# Altium schematic sheet EtherCAT_to_CAN.SchDoc
size 594 x 420 mm; SheetNumber: 1; SheetTotal: 1
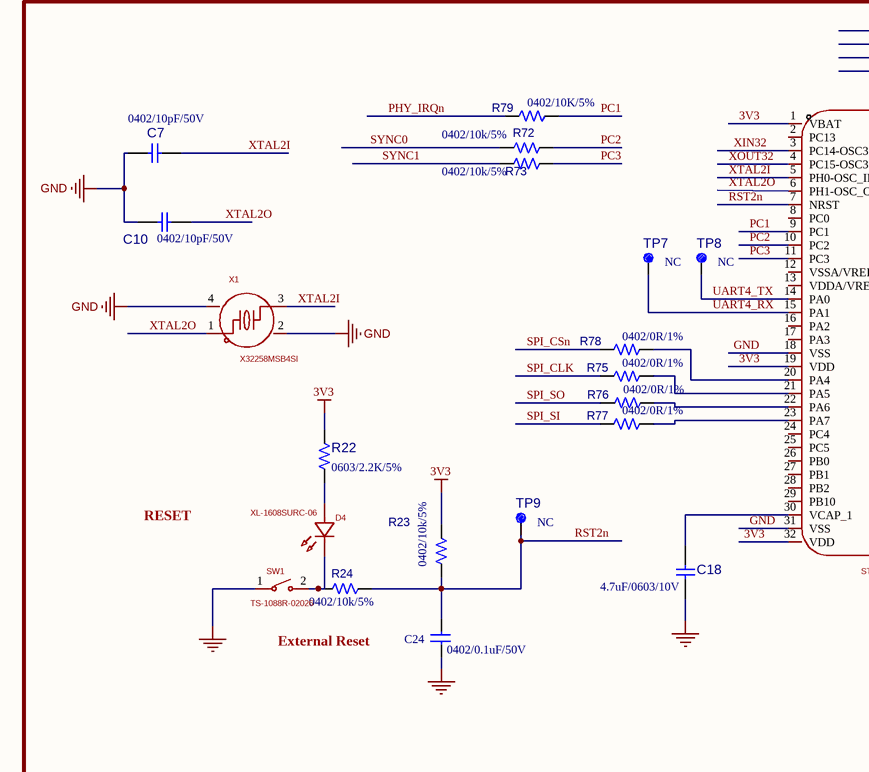
[diagram p0: EtherCAT_to_CAN.SchDoc, top left]
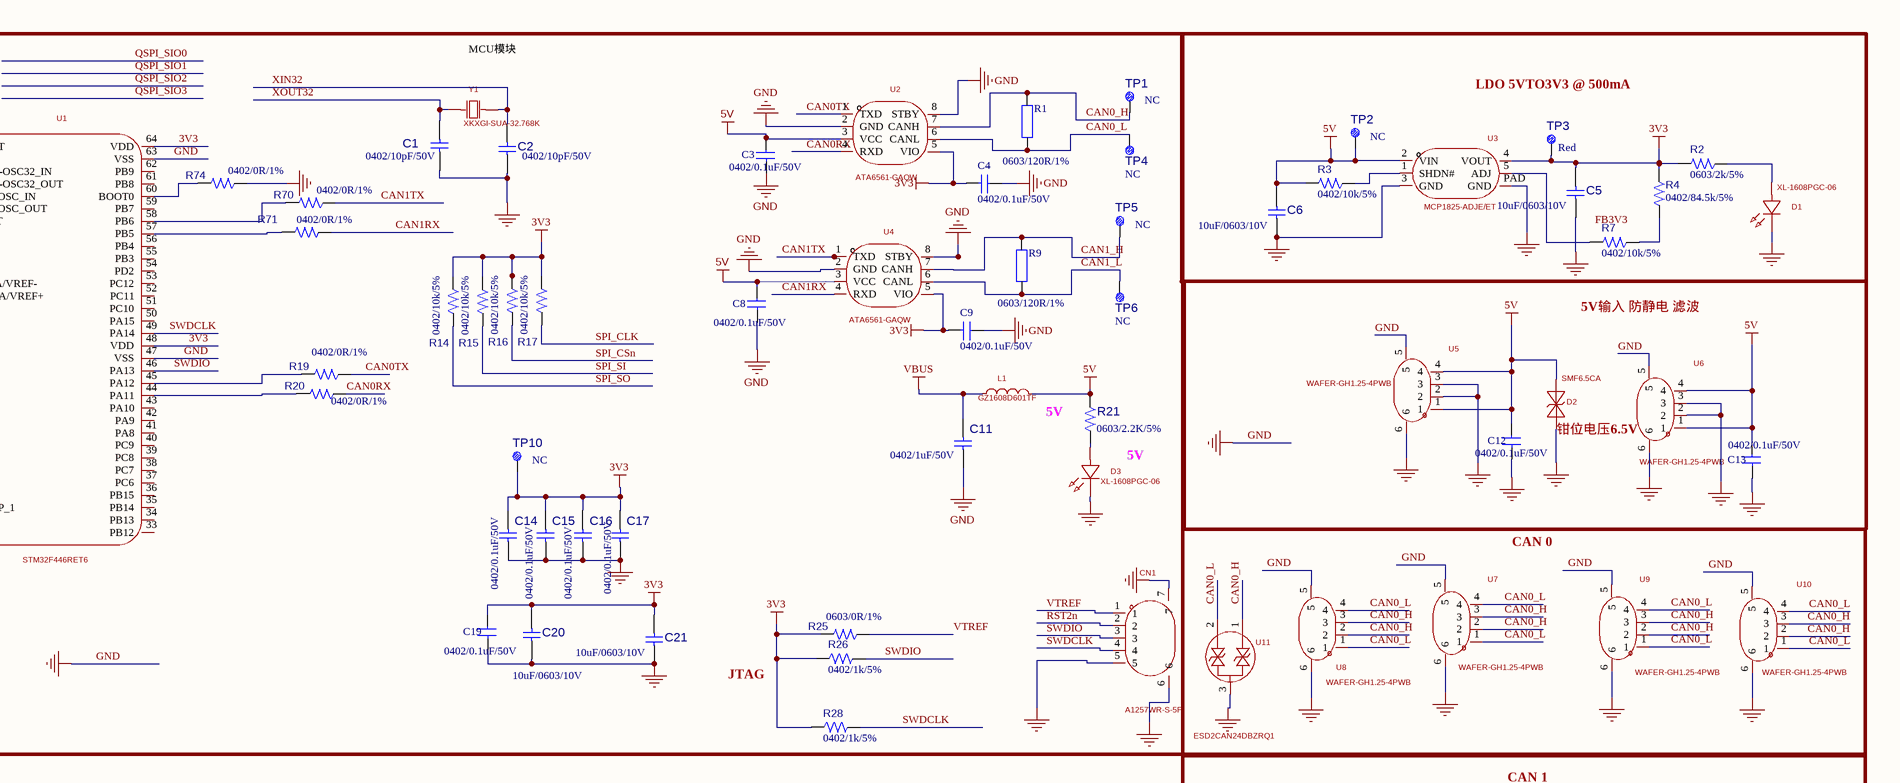
[diagram p1: EtherCAT_to_CAN.SchDoc, top right]
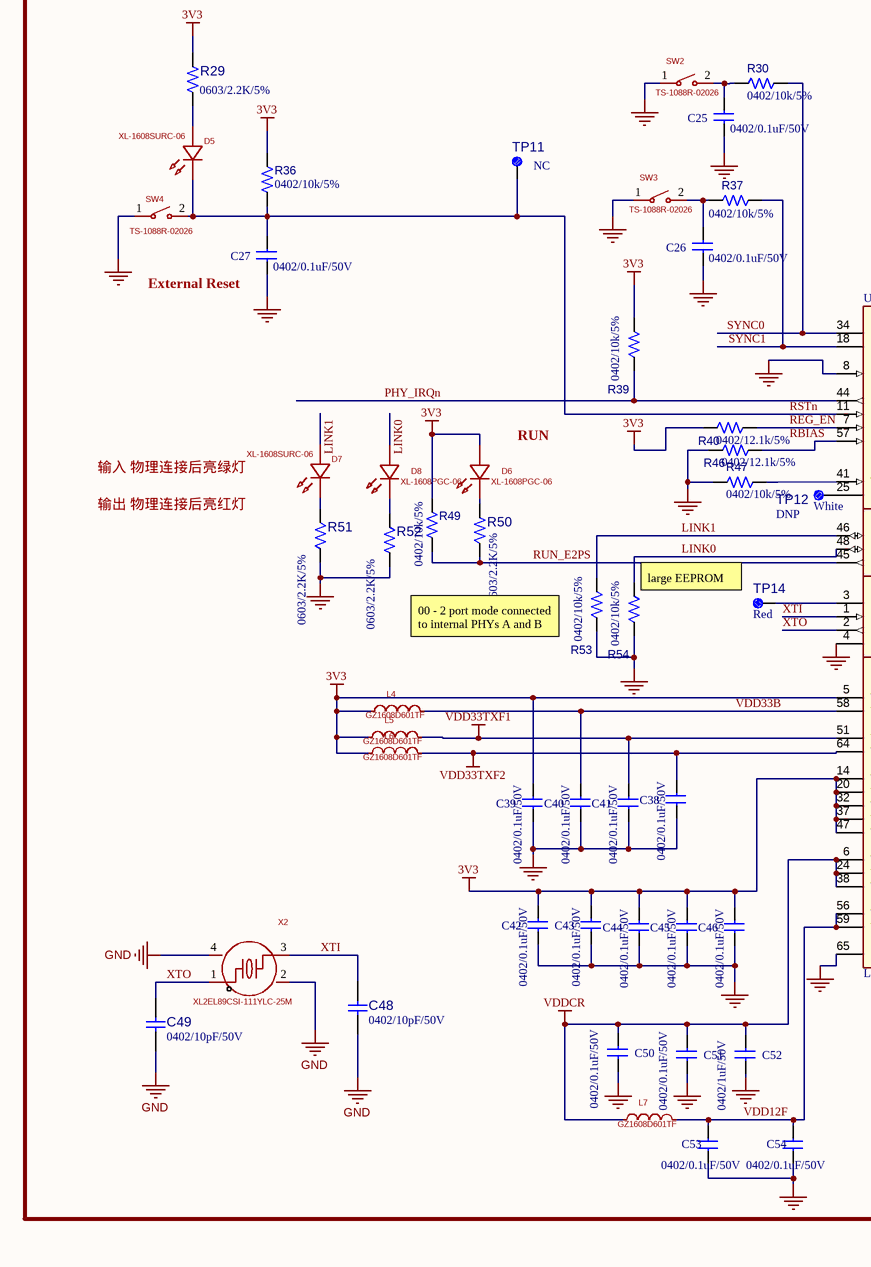
[diagram p2: EtherCAT_to_CAN.SchDoc, bottom left]
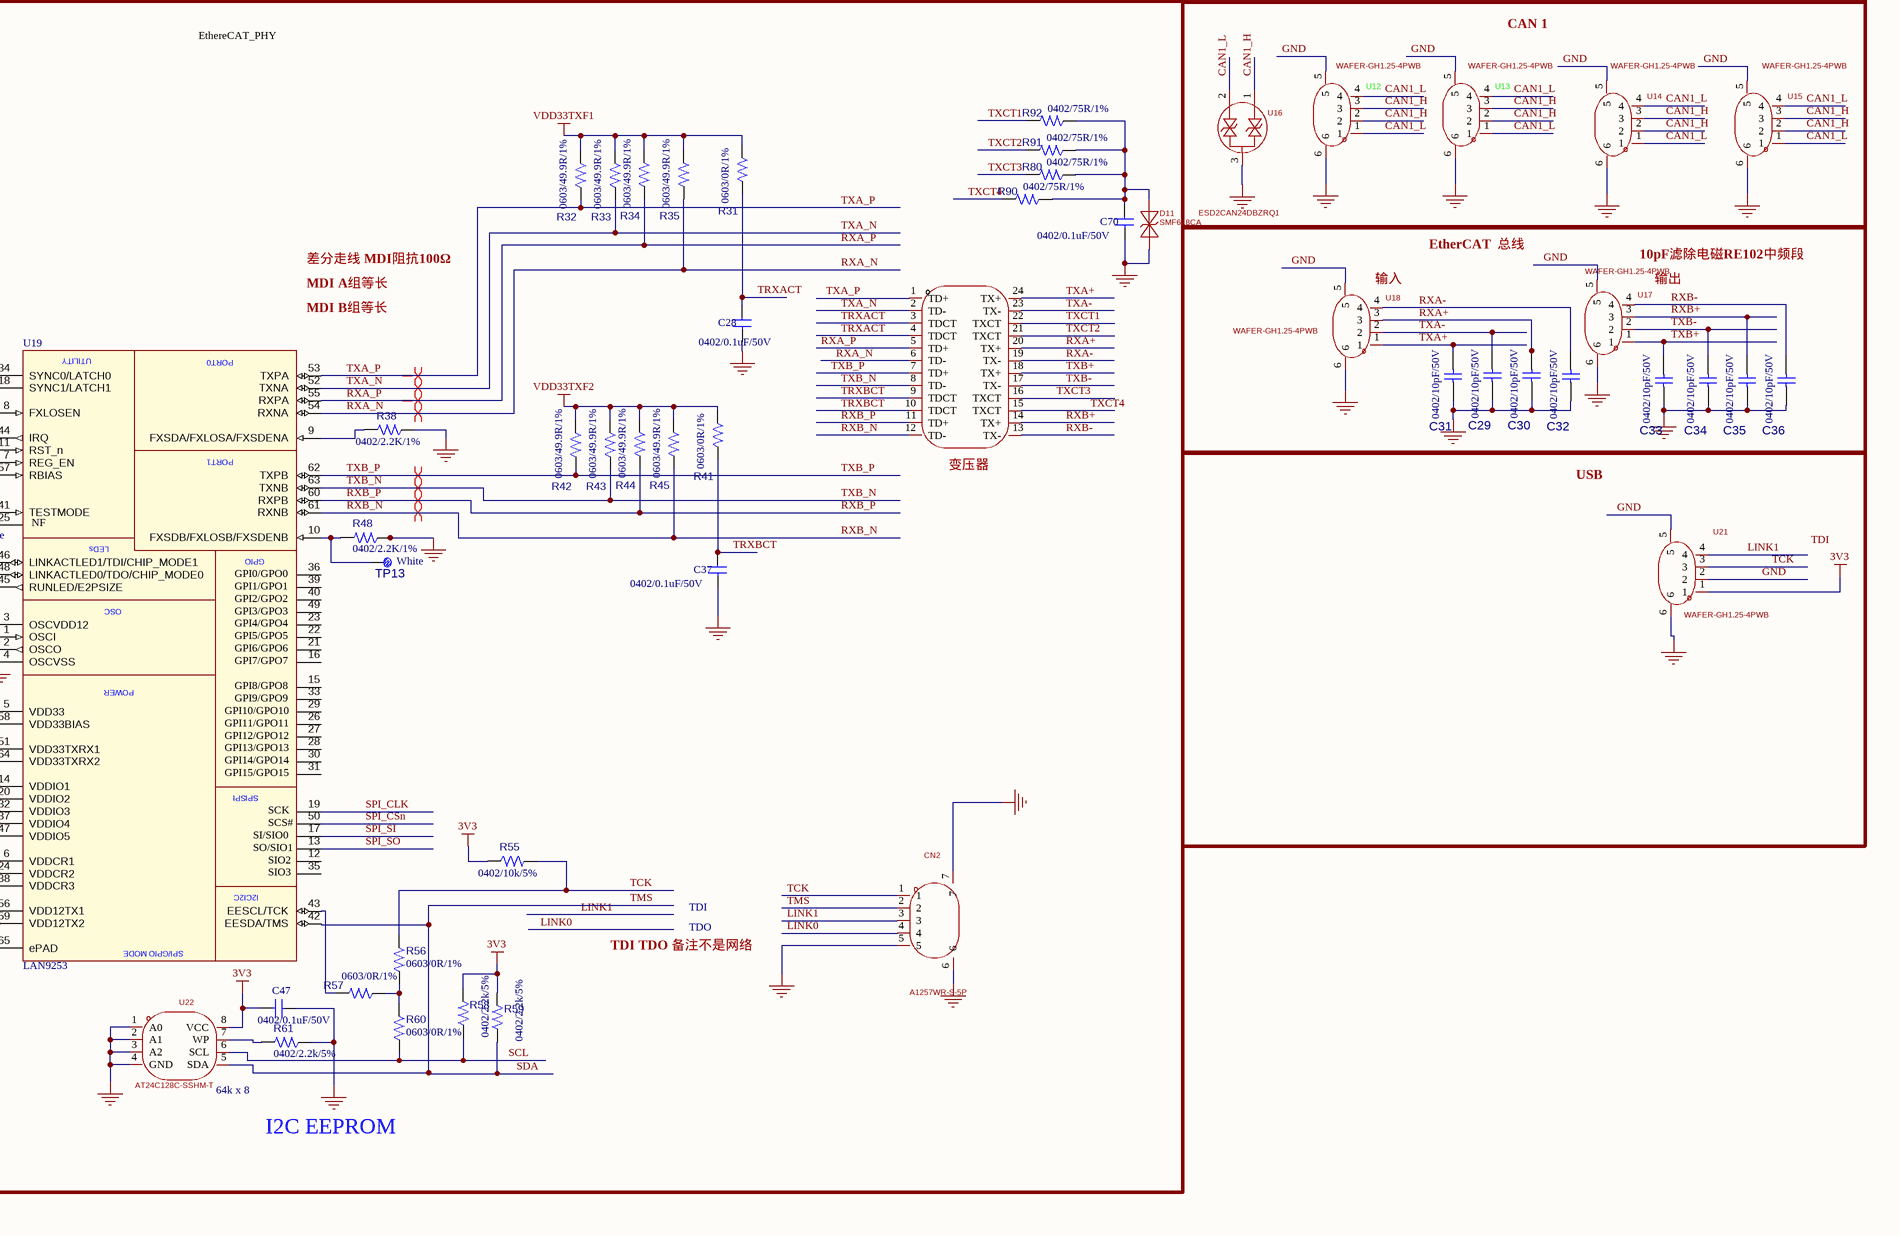
[diagram p3: EtherCAT_to_CAN.SchDoc, bottom right]

## Parts
C1  0402/10pF/50V  [C0402]
C2  0402/10pF/50V  [C0402]
C3  0402/0.1uF/50V  [C0402]
C4  0402/0.1uF/50V  [C0402]
C5  10uF/0603/10V  [C0603]
C6  10uF/0603/10V  [C0603]
C7  0402/10pF/50V  [C0402]
C8  0402/0.1uF/50V  [C0402]
C9  0402/0.1uF/50V  [C0402]
C10  0402/10pF/50V  [C0402]
C11  0402/1uF/50V  [C0402]
C12  0402/0.1uF/50V  [C0402]
C13  0402/0.1uF/50V  [C0402]
C14  0402/0.1uF/50V  [C0402]
C15  0402/0.1uF/50V  [C0402]
C16  0402/0.1uF/50V  [C0402]
C17  0402/0.1uF/50V  [C0402]
C18  4.7uF/0603/10V  [C0603]
C19  0402/0.1uF/50V  [C0402]
C20  10uF/0603/10V  [C0603]
C21  10uF/0603/10V  [C0603]
C24  0402/0.1uF/50V  [C0402]
C25  0402/0.1uF/50V  [C0402]
C26  0402/0.1uF/50V  [C0402]
C27  0402/0.1uF/50V  [C0402]
C28  0402/0.1uF/50V  [C0402]
C29  0402/10pF/50V  [C0402]
C30  0402/10pF/50V  [C0402]
C31  0402/10pF/50V  [C0402]
C32  0402/10pF/50V  [C0402]
C33  0402/10pF/50V  [C0402]
C34  0402/10pF/50V  [C0402]
C35  0402/10pF/50V  [C0402]
C36  0402/10pF/50V  [C0402]
C37  0402/0.1uF/50V  [C0402]
C38  0402/0.1uF/50V  [C0402]
C39  0402/0.1uF/50V  [C0402]
C40  0402/0.1uF/50V  [C0402]
C41  0402/0.1uF/50V  [C0402]
C42  0402/0.1uF/50V  [C0402]
C43  0402/0.1uF/50V  [C0402]
C44  0402/0.1uF/50V  [C0402]
C45  0402/0.1uF/50V  [C0402]
C46  0402/0.1uF/50V  [C0402]
C47  0402/0.1uF/50V  [C0402]
C48  0402/10pF/50V  [C0402]
C49  0402/10pF/50V  [C0402]
C50  0402/0.1uF/50V  [C0402]
C51  0402/0.1uF/50V  [C0402]
C52  0402/1uF/50V  [C0402]
C53  0402/0.1uF/50V  [C0402]
C54  0402/0.1uF/50V  [C0402]
C70  0402/0.1uF/50V  [C0402]
CN1  A1257WR-S-5P  [CONN-SMD_A1257WR-S-5P]
CN2  A1257WR-S-5P  [CONN-SMD_A1257WR-S-5P]
D1  XL-1608PGC-06  [LED0603-RD_GREEN]
D2  SMF6.5CA  [SOD-123FL_L2.7-W1.8-LS3.8-BI]
D3  XL-1608PGC-06  [LED0603-RD_GREEN]
D4  XL-1608SURC-06  [LED0603-RD_RED]
D5  XL-1608SURC-06  [LED0603-RD_RED]
D6  XL-1608PGC-06  [LED0603-RD_GREEN]
D7  XL-1608SURC-06  [LED0603-RD_RED]
D8  XL-1608PGC-06  [LED0603-RD_GREEN]
D11  SMF618CA  [SOD-123FL_L2.7-W1.8-LS3.8-BI]
L1  GZ1608D601TF  [L0603]
L4  GZ1608D601TF  [L0603]
L5  GZ1608D601TF  [L0603]
L6  GZ1608D601TF  [L0603]
L7  GZ1608D601TF  [L0603]
R1  0603/120R/1%  [R0603]
R2  0603/2k/5%  [R0603]
R3  0402/10k/5%  [R0402]
R4  0402/84.5k/5%  [R0402]
R7  0402/10k/5%  [R0402]
R9  0603/120R/1%  [R0603]
R14  0402/10k/5%  [R0402]
R15  0402/10k/5%  [R0402]
R16  0402/10k/5%  [R0402]
R17  0402/10k/5%  [R0402]
R19  0402/0R/1%  [R0402]
R20  0402/0R/1%  [R0402]
R21  0603/2.2K/5%  [R0603]
R22  0603/2.2K/5%  [R0603]
R23  0402/10k/5%  [R0402]
R24  0402/10k/5%  [R0402]
R25  0603/0R/1%  [R0603]
R26  0402/1k/5%  [R0402]
R28  0402/1k/5%  [R0402]
R29  0603/2.2K/5%  [R0603]
R30  0402/10k/5%  [R0402]
R31  0603/0R/1%  [R0603]
R32  0603/49.9R/1%  [R0603]
R33  0603/49.9R/1%  [R0603]
R34  0603/49.9R/1%  [R0603]
R35  0603/49.9R/1%  [R0603]
R36  0402/10k/5%  [R0402]
R37  0402/10k/5%  [R0402]
R38  0402/2.2K/1%  [R0402]
R39  0402/10k/5%  [R0402]
R40  0402/12.1k/5%  [R0402]
R41  0603/0R/1%  [R0603]
R42  0603/49.9R/1%  [R0603]
R43  0603/49.9R/1%  [R0603]
R44  0603/49.9R/1%  [R0603]
R45  0603/49.9R/1%  [R0603]
R46  0402/12.1k/5%  [R0402]
R47  0402/10k/5%  [R0402]
R48  0402/2.2K/1%  [R0402]
R49  0402/10k/5%  [R0402]
R50  0603/2.2K/5%  [R0603]
R51  0603/2.2K/5%  [R0603]
R52  0603/2.2K/5%  [R0603]
R53  0402/10k/5%  [R0402]
R54  0402/10k/5%  [R0402]
R55  0402/10k/5%  [R0402]
R56  0603/0R/1%  [R0603]
R57  0603/0R/1%  [R0603]
R58  0402/2.2k/5%  [R0402]
R59  0402/2.2k/5%  [R0402]
R60  0603/0R/1%  [R0603]
R61  0402/2.2k/5%  [R0402]
R70  0402/0R/1%  [R0402]
R71  0402/0R/1%  [R0402]
R72  0402/10k/5%  [R0402]
R73  0402/10k/5%  [R0402]
R74  0402/0R/1%  [R0402]
R75  0402/0R/1%  [R0402]
R76  0402/0R/1%  [R0402]
R77  0402/0R/1%  [R0402]
R78  0402/0R/1%  [R0402]
R79  0402/10K/5%  [R0402]
R80  0402/75R/1%  [R0402]
R90  0402/75R/1%  [R0402]
R91  0402/75R/1%  [R0402]
R92  0402/75R/1%  [R0402]
SW1  TS-1088R-02026  [SW-SMD_L3.9-W3.0-P4.45]
SW2  TS-1088R-02026  [SW-SMD_L3.9-W3.0-P4.45]
SW3  TS-1088R-02026  [SW-SMD_L3.9-W3.0-P4.45]
SW4  TS-1088R-02026  [SW-SMD_L3.9-W3.0-P4.45]
TP1  Populated: NC  [TEST_1.2]  (hidden comment: Test Point)
TP2  Populated: NC  [TEST_1.2]  (hidden comment: Test Point)
TP3  value Red  [TEST_1.2]  (hidden comment: Test Point)
TP4  Populated: NC  [TEST_1.2]  (hidden comment: Test Point)
TP5  Populated: NC  [TEST_1.2]  (hidden comment: Test Point)
TP6  Populated: NC  [TEST_1.2]  (hidden comment: Test Point)
TP7  Populated: NC  [TEST_1.2]  (hidden comment: Test Point)
TP8  Populated: NC  [TEST_1.2]  (hidden comment: Test Point)
TP9  Populated: NC  [TEST_1.2]  (hidden comment: Test Point)
TP10  Populated: NC  [TEST_1.2]  (hidden comment: Test Point)
TP11  Populated: NC  [TEST_1.2]  (hidden comment: Test Point)
TP12  value White  Populated: DNP  [TEST_1.2]  (hidden comment: Test Point)
TP13  value White  [TEST_1.2]  (hidden comment: Test Point)
TP14  value Red  [TEST_1.2]  (hidden comment: Test Point)
U1  STM32F446RET6  [LQFP-64_L10.0-W10.0-P0.50-LS12.0-BL]
U2  ATA6561-GAQW  [SOIC-8_L4.9-W3.9-P1.27-LS6.0-BL]
U3  MCP1825-ADJE/ET  [D2PAK-5_L9.2-W10.0-P1.70-LS14.2-BR]
U4  ATA6561-GAQW  [SOIC-8_L4.9-W3.9-P1.27-LS6.0-BL]
U5  WAFER-GH1.25-4PWB  [CONN-SMD_4P-P1.25_XUNPU_WAFER-GH1.25-4PWB]
U6  WAFER-GH1.25-4PWB  [CONN-SMD_4P-P1.25_XUNPU_WAFER-GH1.25-4PWB]
U7  WAFER-GH1.25-4PWB  [CONN-SMD_4P-P1.25_XUNPU_WAFER-GH1.25-4PWB]
U8  WAFER-GH1.25-4PWB  [CONN-SMD_4P-P1.25_XUNPU_WAFER-GH1.25-4PWB]
U9  WAFER-GH1.25-4PWB  [CONN-SMD_4P-P1.25_XUNPU_WAFER-GH1.25-4PWB]
U10  WAFER-GH1.25-4PWB  [CONN-SMD_4P-P1.25_XUNPU_WAFER-GH1.25-4PWB]
U11  ESD2CAN24DBZRQ1  [SOT-23-3_L2.9-W1.3-P1.90-LS2.4-BR]
U12  WAFER-GH1.25-4PWB  [CONN-SMD_4P-P1.25_XUNPU_WAFER-GH1.25-4PWB]
U13  WAFER-GH1.25-4PWB  [CONN-SMD_4P-P1.25_XUNPU_WAFER-GH1.25-4PWB]
U14  WAFER-GH1.25-4PWB  [CONN-SMD_4P-P1.25_XUNPU_WAFER-GH1.25-4PWB]
U15  WAFER-GH1.25-4PWB  [CONN-SMD_4P-P1.25_XUNPU_WAFER-GH1.25-4PWB]
U16  ESD2CAN24DBZRQ1  [SOT-23-3_L2.9-W1.3-P1.90-LS2.4-BR]
U17  WAFER-GH1.25-4PWB  [CONN-SMD_4P-P1.25_XUNPU_WAFER-GH1.25-4PWB]
U18  WAFER-GH1.25-4PWB  [CONN-SMD_4P-P1.25_XUNPU_WAFER-GH1.25-4PWB]
U19  value LAN9253  [QFN-64_L9.0-W9.0-P0.50-BL-EP6.0]  (hidden comment: LAN9252 QFN-64)
U20  G2426S  [XFMR-SMD_24P-L15.6-W8.5-P1.27-LS9.5-BL]  (value not drawn)
U21  WAFER-GH1.25-4PWB  [CONN-SMD_4P-P1.25_XUNPU_WAFER-GH1.25-4PWB]
U22  AT24C128C-SSHM-T  [SOIC-8_L4.9-W3.9-P1.27-LS6.0-BL]
X1  X32258MSB4SI  [CRYSTAL-SMD_4P-L3.2-W2.5-BL]
X2  XL2EL89CSI-111YLC-25M  [CRYSTAL-SMD_4P-L3.2-W2.5-BL]
Y1  XKXGI-SUA-32.768K  [CRYSTAL-SMD_L3.2-W1.5-1]

## Blocks framed on the sheet
LDO 5VTO3V3 @ 500mA: C5 C6 D1 R2-R4 R7 TP2 TP3 U3
CAN 0: U7-U11
I2C EEPROM: C25-C28 C37-C54 C70 CN2 D5-D8 D11 L4-L7 R29-R61 R80 R90-R92 SW2-SW4 TP11-TP14 U19 U20 U22 X2
CAN 1: U12-U16
USB: U21

## Nets
3V3: C4.2 C5.2 C9.2 C14.2 C15.2 C16.2 C17.2 C19.2 C20.2 C21.2 C39.2 C42.2 C43.2 C44.2 C45.2 C46.2 C47.2 D6.2(A) L4.1 L5.1 L6.1 R2.2 R4.1 R14.1 R15.1 R16.1 R17.1 R22.1 R23.1 R25.2 R26.1 R28.1 R29.1 R36.1 R39.1 R40.1 R49.1 R55.1 R58.2 R59.2 TP3.1 TP10.1 U1.1(VBAT) U1.19(VDD) U1.32(VDD) U1.48(VDD) U1.64(VDD) U2.5(VIO) U3.4(VOUT) U4.5(VIO) U19.5(VDD33) U19.14(VDDIO1) U19.20(VDDIO2) U19.32(VDDIO3) U19.37(VDDIO4) U19.47(VDDIO5) U21.1 U22.8(VCC)
5V: C3.2 C6.2 C8.2 C12.2 C13.2 D2.2 L1.2 R3.2 R21.1 TP2.1 U2.3(VCC) U3.2(VIN) U4.3(VCC) U5.1 U5.4 U6.1 U6.4
GND: C1.1 C2.1 C3.1 C4.1 C5.1 C6.1 C7.1 C8.1 C9.1 C10.2 C11.1 C12.1 C13.1 C14.1 C15.1 C16.1 C17.1 C18.1 C19.1 C20.1 C21.1 C24.1 C25.1 C26.1 C27.1 C28.1 C29.1 C30.1 C31.1 C32.1 C33.1 C34.1 C35.1 C36.1 C37.1 C38.1 C39.1 C40.1 C41.1 C42.1 C43.1 C44.1 C45.1 C46.1 C47.1 C48.1 C49.1 C50.1 C51.1 C52.1 C53.1 C54.1 C70.1 CN1.5 CN1.6 CN1.7 CN2.5 CN2.6 CN2.7 D1.1(K) D2.1 D3.1(K) D11.1 R38.1 R46.1 R47.2 R48.1 R51.2 R52.2 R53.2 R54.2 R61.1 R74.1 SW1.1 SW2.1 SW3.1 SW4.1 U1.18(VSS) U1.31(VSS) U1.47(VSS) U1.63(VSS) U2.2(GND) U2.8(STBY) U3.3(GND) U3.PAD(GND) U4.2(GND) U4.8(STBY) U5.2 U5.3 U5.5 U5.6 U6.2 U6.3 U6.5 U6.6 U7.5 U7.6 U8.5 U8.6 U9.5 U9.6 U10.5 U10.6 U11.3(GND) U12.5 U12.6 U13.5 U13.6 U14.5 U14.6 U15.5 U15.6 U16.3(GND) U17.5 U17.6 U18.5 U18.6 U19.4(OSCVSS) U19.8(FXLOSEN) U19.65(ePAD) U21.2 U21.5 U21.6 U22.1(A0) U22.2(A1) U22.3(A2) U22.4(GND) X1.2(GND) X1.4(GND) X2.2(GND) X2.4(GND)
VBUS: C11.2 L1.1
VDD33TXF1: C41.2 L5.2 R31.1 R32.1 R33.1 R34.1 R35.1 U19.51(VDD33TXRX1)
VDD33TXF2: C38.2 L6.2 R41.1 R42.1 R43.1 R44.1 R45.1 U19.64(VDD33TXRX2)
VDDCR: C50.2 C51.2 C52.2 L7.1 U19.6(VDDCR1) U19.24(VDDCR2) U19.38(VDDCR3)
CAN0_H: R1.2 TP1.1 U2.7(CANH) U7.2 U7.3 U8.2 U8.3 U9.2 U9.3 U10.2 U10.3 U11.1(IO)
CAN0_L: R1.1 TP4.1 U2.6(CANL) U7.1 U7.4 U8.1 U8.4 U9.1 U9.4 U10.1 U10.4 U11.2(IO)
CAN0RX: R20.1 U2.4(RXD)
CAN0TX: R19.1 U2.1(TXD)
CAN1_H: R9.2 TP5.1 U4.7(CANH) U12.2 U12.3 U13.2 U13.3 U14.2 U14.3 U15.2 U15.3 U16.1(IO)
CAN1_L: R9.1 TP6.1 U4.6(CANL) U12.1 U12.4 U13.1 U13.4 U14.1 U14.4 U15.1 U15.4 U16.2(IO)
CAN1RX: R71.1 U4.4(RXD)
CAN1TX: R70.1 U4.1(TXD)
LINK0: CN2.4 D8.2(A) R54.1 U19.48(LINKACTLED0/TDO/CHIP_MODE0)
LINK1: CN2.3 D7.2(A) R53.1 U19.46(LINKACTLED1/TDI/CHIP_MODE1) U21.4
PC1: R79.1 U1.9(PC1)
PC2: R72.1 U1.10(PC2)
PC3: R73.1 U1.11(PC3)
PHY_IRQn: R39.2 R79.2 U19.44(IRQ)
REG_EN: R40.2 U19.7(REG_EN)
RST2n: C24.2 CN1.2 R23.2 R24.1 TP9.1 U1.7(NRST)
RSTn: C27.2 D5.1(K) R36.2 SW4.2 TP11.1 U19.11(RST_n)
RUN_E2PS: R49.2 R50.2 U19.45(RUNLED/E2PSIZE)
RXA+: C30.2 U18.3 U20.20(TX+)
RXA-: C32.2 U18.4 U20.19(TX-)
RXA_N: R35.2 U19.54(RXNA) U20.6(TD-)
RXA_P: R34.2 U19.55(RXPA) U20.5(TD+)
RXB+: C35.2 U17.3 U20.14(TX+)
RXB-: C36.2 U17.4 U20.13(TX-)
RXB_N: R45.2 U19.61(RXNB) U20.12(TD-)
RXB_P: R44.2 U19.60(RXPB) U20.11(TD+)
SCL: R58.1 R60.2 U22.6(SCL)
SDA: CN2.2 R59.1 U19.42(EESDA/TMS) U22.5(SDA)  [also labelled TMS]
SPI_CLK: R17.2 R75.2 U19.19(D9/AD9/LATCH_IN/SCK)
SPI_CSn: R16.2 R78.2 U19.50(D5/AD5/OUTVALID/SCS#)
SPI_SI: R15.2 R77.2 U19.17(D0/AD0/WD_STATE/SI/SIO0)
SPI_SO: R14.2 R76.2 U19.13(D1/AD1/EOF/SO/SIO1)
SWDCLK: CN1.4 R28.2 U1.49(PA14)
SWDIO: CN1.3 R26.2 U1.46(PA13)
SYNC0: R30.1 R72.2 U19.34(SYNC0/LATCH0)
SYNC1: R37.1 R73.2 U19.18(SYNC1/LATCH1)
TCK: CN2.1 R55.2 R56.1 U21.3
TRXACT: C28.2 R31.2 U20.3(TDCT) U20.4(TDCT)
TRXBCT: C37.2 R41.2 U20.9(TDCT) U20.10(TDCT)
TXA+: C31.2 U18.1 U20.24(TX+)
TXA-: C29.2 U18.2 U20.23(TX-)
TXA_N: R33.2 U19.52(TXNA) U20.2(TD-)
TXA_P: R32.2 U19.53(TXPA) U20.1(TD+)
TXB+: C33.2 U17.1 U20.18(TX+)
TXB-: C34.2 U17.2 U20.17(TX-)
TXB_N: R43.2 U19.63(TXNB) U20.8(TD-)
TXB_P: R42.2 U19.62(TXPB) U20.7(TD+)
TXCT1: R92.2 U20.22(TXCT)
TXCT2: R91.2 U20.21(TXCT)
TXCT3: R80.2 U20.16(TXCT)
TXCT4: R90.2 U20.15(TXCT)
UART4_RX: TP7.1 U1.15(PA1)
UART4_TX: TP8.1 U1.14(PA0)
VDD12F: C53.2 C54.2 L7.2 U19.56(VDD12TX1) U19.59(VDD12TX2)
VDD33B: C40.2 L4.2 U19.58(VDD33BIAS)
VTREF: CN1.1 R25.1
XIN32: C2.2 U1.3(PC14-OSC32_IN) Y1.2(OSC2)
XOUT32: C1.2 U1.4(PC15-OSC32_OUT) Y1.1(OSC1)
XTAL2I: C7.2 U1.5(PH0-OSC_IN) X1.3
XTAL2O: C10.1 U1.6(PH1-OSC_OUT) X1.1
XTI: C48.2 U19.1(OSCI) X2.3
XTO: C49.2 U19.2(OSCO) X2.1
NetC18_2: C18.2 U1.30(VCAP_1)
NetC25_2: C25.2 R30.2 SW2.2
NetC26_2: C26.2 R37.2 SW3.2
NetC70_2: C70.2 D11.2 R80.1 R90.1 R91.1 R92.1
NetD1_2: D1.2(A) R2.1
NetD3_2: D3.2(A) R21.2
NetD4_1: D4.1(K) R24.2 SW1.2
NetD4_2: D4.2(A) R22.2
NetD5_2: D5.2(A) R29.2
NetD6_1: D6.1(K) R50.1
NetD7_1: D7.1(K) R51.1
NetD8_1: D8.1(K) R52.1
NetR3_1: R3.1 U3.1(SHDN#)
NetR4_2: R4.2 R7.1
NetR7_2: R7.2 U3.5(ADJ)
NetR19_2: R19.2 U1.45(PA12)
NetR20_2: R20.2 U1.44(PA11)
NetR38_2: R38.2 U19.9(FXSDA/FXLOSA/FXSDENA)
NetR46_2: R46.2 U19.57(RBIAS)
NetR47_1: R47.1 U19.41(TESTMODE)
NetR48_2: R48.2 TP13.1 U19.10(FXSDB/FXLOSB/FXSDENB)
NetR56_2: R56.2 R57.1 R60.1
NetR57_2: R57.2 U19.43(EESCL/TCK)
NetR61_2: R61.2 U22.7(WP)
NetR70_2: R70.2 U1.58(PB6)
NetR71_2: R71.2 U1.57(PB5)
NetR74_2: R74.2 U1.60(BOOT0)
NetR75_1: R75.1 U1.21(PA5)
NetR76_1: R76.1 U1.22(PA6)
NetR77_1: R77.1 U1.23(PA7)
NetR78_1: R78.1 U1.20(PA4)
NetTP12_1: TP12.1 U19.25(A1/ALELO/OE_EXT/MII_CLK25)
NetTP14_1: TP14.1 U19.3(OSCVDD12)

Not connected (* = marked no-connect by the designer): U1 2(PC13) 8(PC0) 12(VSSA/VREF-) 13(VDDA/VREF+) 16(PA2) 17(PA3) 24(PC4) 25(PC5) 26(PB0) 27(PB1) 28(PB2) 29(PB10) 33(PB12) 34(PB13) 35(PB14) 36(PB15) 37(PC6) 38(PC7) 39(PC8) 40(PC9) 41(PA8) 42(PA9) 43(PA10) 50(PA15) 51(PC10) 52(PC11) 53(PC12) 54(PD2) 55(PB3) 56(PB4) 59(PB7) 61(PB8) 62(PB9); U19 12(D2/AD2/SOF/SIO2) 15(D14/AD14/DIGIO8/GPI8/GPO8/MII_TXD3/TX_SHIFT1) 16(D13/AD13/DIGIO7/GPI7/GPO7/MII_TXD2/TX_SHIFT0) 21(D12/AD12/DIGIO6/GPI6/GPO6/MII_TXD1) 22(D11/AD11/DIGIO5/GPI5/GPO5/MII_TXD0) 23(D10/AD10/DIGIO4/GPI4/GPO4/MII_TXEN) 26(A3/DIGIO11/GPI11/GPO11/MII_RXDV) 27(A4/DIGIO12/GPI12/GPO12/MII_RXD0) 28(CS/DIGIO13/GPI13/GPO13/MII_RXD1) 29(A2/ALEHI/DIGIO10/GPI10/GPO10/LINKACTLED2/MII_LINKPOL) 30(WR/ENB/DIGIO14/GPI14/GPO14/MII_RXD2) 31(RD/RD_WR/DIGIO15/GPI15/GPO15/MII_RXD3) 33(A0/D15/AD15/DIGIO9/GPI9/GPO9/MII_RXER) 35(D3/AD3/WD_TRIG/SIO3) 36(D6/AD6/DIGIO0/GPI0/GPO0/MII_RXCLK) 39(D7/AD7/DIGIO1/GPI1/GPO1/MII_MDC) 40(D8/AD8/DIGIO2/GPI2/GPO2/MII_MDIO) 49(D4/AD4/DIGIO3/GPI3/GPO3/MII_LINK)

## Layout directives
differential pair; net class GBE: RXA_N, RXA_P, RXB_N, RXB_P, TXA_N, TXA_P, TXB_N, TXB_P

## Notes on the sheet
- (near Y1) MCU模块
- 5V输入 防静电 滤波
- 5V
- (near D2) 钳位电压6.5V
- RESET
- External Reset
- JTAG
- EthereCAT_PHY
- (near U12) Type @ to refer to a designator or a net
- (near U13) Type @ to refer to a designator or a net
- (near U14) Type @ to refer to a designator or a net
- (near U15) Type @ to refer to a designator or a net
- 差分走线 MDI阻抗100Ω
- EtherCAT  总线
- (near U17) 10pF滤除电磁RE102中频段
- MDI A组等长
- MDI B组等长
- (near U18) 输入
- (near U17) 输出
- (near C27) External Reset
- 输入 物理连接后亮绿灯
- (near D6) RUN
- (near U20) 变压器
- 输出 物理连接后亮红灯
- (near R54) large EEPROM
- 00 - 2 port mode connected to internal PHYs A and B
- TDI
- TDO
- TDI TDO 备注不是网络
- (near U22) 64k x 8
- Labels drawn without touching a wire or pin: FB3V3, RBIAS, TDI
- DWG NO:
- REV:
- THIS DOCUMENT AND THE DATA DISCLOSED HEREIN OR
- HEREWITH IS THE PROPERTY OF ALTIUM LIMITED AND MAY
- BE FREELY DISTRIBUTED IN WHOLE. NO RIGHTS ARE
- RESERVED OR EXPRESS OR IMPLIED WARANTEE GIVEN.
- REVISION
- DESCRIPTION
- DATE
- APPROVED
- ENG:
- APPROVALS
- PROJECT
- DSN:
- CHK:
- REFERENCE DOCUMENTS
- PROJECT REVISION:
- TITLE
- DOCUMENT REVISION:
- DESIGN ITEM:
- BOM:
- FAB DWG:
- PCB DWG:
- ASSY DWG:
- SCALE:
- A2
- SIZE
- CAGE CODE
- FILE NAME
- DWG NO.
- SHEET
- OF
- REV
- (in symbol MIC7449) UTILITY; PORT0; PORT1; NF; LEDs; GPIO; GPI0/GPO0; GPI1/GPO1; OSC; GPI2/GPO2; GPI3/GPO3; GPI4/GPO4; GPI5/GPO5; GPI6/GPO6; GPI7/GPO7; POWER; GPI8/GPO8; GPI9/GPO9; GPI10/GPO10; GPI11/GPO11; GPI12/GPO12; GPI13/GPO13; GPI14/GPO14; GPI15/GPO15; SPI; SCK; SCS#; SI/SIO0; SO/SIO1; SIO2; SIO3; I2C; SPI/GPIO MODE

## Library data of the parts
C1 C2 C7 C10 C29-C36 C48 C49 = CAP2057: Capacitor; Manufacturer 1: AVX Corporation; Manufacturer Part Number 1: 04025A100JAT2A; Voltage: 50V; Description_: CAP CER 10pF 50V 5% NP0 SMD 0402; Dev Tools Status: Design; Tolerance: 5%; Temperature Coeffcient: 100ppm/C; Type: Ceramic; Owner: Ciprian Abramov; Populated: YES; MCHP-ID: CAP2057; Package: 0402; Revision: 1; Symbol: Capacitor NP; Status: MCL Design; ComponentLink1URL: https://chn-vm-apps.microchip.com/mchprepo/parts/Datasheets/C0GNP0-Dielectric.pdf; ComponentLink1Description: SVN Datasheet; ComponentLink2URL: C:\ALTIUM_WORK\00001_MCHP-CDB\Datasheets\C0GNP0-Dielectric.pdf; ComponentLink2Description: Local Datasheet; ComponentLink3URL: C:\ALTIUM_WORK\00001_MCHP-CDB\Library\LibraryRefs\Capacitor NP.SchLib; ComponentLink3Description: Open Symbol; ComponentLink4URL: C:\ALTIUM_WORK\00001_MCHP-CDB\Library\Footprints\CAP_C_0402.PcbLib; ComponentLink4Description: Open Footprint; ComponentLink5Description: Open Footprint 2; ComponentLink6Description: Open Footprint 3; ComponentLink7Description: Open Footprint 4; Operating Temperature: -55C to +125C; Category: Capacitor; Supplier 1: Digi-Key; Supplier Part Number 1: 478-1070-1-ND; Quantity Override: 1
C3 C4 C8 C9 C12 C13 C19 C24-C28 C37-C47 C50-C54 C70 = CAP: 电容
C5 C6 C18 C20 C21 = CAP0373: Capacitor; Manufacturer 1: Murata; Manufacturer Part Number 1: GRM21BR61C106KE15L; Voltage: 16V; Description_: CAP CER 10uF 16V 10% X5R SMD 0805; Tolerance: 10%; Temperature Coeffcient: X5R; Type: Ceramic; Populated: Yes; MCHP-ID: CAP0373; Package: 0805; Revision: 1; Status: Production; ComponentLink1URL: https://chn-vm-apps.microchip.com/mchprepo/parts/Datasheets/L0005E.pdf; ComponentLink1Description: Datasheet; Operating Temperature: +25C to +125C; Category: Capacitor; Manufacturer 2: Taiyo Yuden; Manufacturer Part Number 2: EMK212BJ106KG-T; Supplier 1: Digi-Key; Supplier Part Number 1: 490-3886-1-ND; Supplier 2: Digi-Key; Supplier Part Number 2: 587-1295-1-ND; Supplier 3: Newark; Supplier Part Number 3: 30K5459; Quantity Override: 1
C11 C14-C17 = CAP1033: Capacitor; Manufacturer 1: Murata; Manufacturer Part Number 1: GRM155R71C104KA88D; Voltage: 16V; Description_: CAP CER 0.1uF 16V 10% X7R SMD 0402; Tolerance: 10%; Temperature Coeffcient: X7R; Type: Ceramic; Owner: Sompoch Loboonlert; Populated: Yes; MCHP-ID: CAP1033; Package: 0402; Revision: 2; Status: Production; ComponentLink1URL: https://chn-vm-apps.microchip.com/mchprepo/parts/Datasheets/L0005E.pdf; ComponentLink1Description: Datasheet; Operating Temperature: -55C to +125C; Category: Capacitor; Supplier 1: Digi-Key; Supplier Part Number 1: 490-3261-2-ND; Quantity Override: 1
CN1 CN2 = A1257WR-S-5P: Manufacturer: CJT(长江连接器); Add into BOM: yes; Pins Structure: 1x5P; Pitch: 1.25mm; Reference Series: GH; Number of PINs Per Row: 5; Symbol: A1257WR-S-5P; Device: A1257WR-S-5P; LCSC Part Name: 系列:GH 间距:1.25mm 1x5P; Supplier Part: C225128; Manufacturer Part: A1257WR-S-5P; Supplier Footprint: SMD,P=1.25mm,卧贴; JLCPCB Part Class: Extended Part; Datasheet: https://atta.szlcsc.com/upload/public/pdf/source/20181008/C272994_C9E89FA8A36D0009CAD30AD8C59C2782.pdf; Supplier: LCSC; Convert to PCB: yes; Mounting Style: -; Number of Pins: 5P; Number of Rows: 1; Row Spacing: -; Contact Material: 黄铜
D1 D3 D6 D8 = XL-1608PGC-06: Manufacturer: XINGLIGHT(成兴光); Add into BOM: yes; Emitted Color: 翠绿色; Forward Voltage (VF): 2.6V~3V; Power Dissipation: 75mW; Forward Current: 5mA; Dominant Wavelength: 505nm~540nm; Peak Wavelength: 530nm; Lens Color: 绿色透镜; Luminous Intensity: 299mcd; Viewing Angle: 130°; Mounting Sytle: 正贴; Symbol: XL-1608PGC-06; Device: XL-1608PGC-06; LCSC Part Name: XL-1608PGC-06; Supplier Part: C7371905; Manufacturer Part: XL-1608PGC-06; Supplier Footprint: 0603; JLCPCB Part Class: Extended Part; Datasheet: https://atta.szlcsc.com/upload/public/pdf/source/20240218/2F8A7AF596DEEB38157DAB7856E382C0.pdf; Supplier: LCSC; Convert to PCB: yes; Lamp Holder Type: -; Diode Configuration: -; Color Temperature: -; Operating Temperature: -
D2 D11 = SMF6.5CA_C19077501: Manufacturer: 宏迦橙; Add into BOM: yes; polarity: 双向; Reverse Stand-Off Voltage (Vrwm): 6.5V; Maximum Clamping Voltage: 11.2V; Peak Pulse Current (Ipp): 17.9A; Peak Pulse Power Dissipation (Ppp): 200W; Breakdown Voltage: 7.22V; Reverse Leakage Current (Ir): 1uA; Number of Lines: 单路; Type: TVS; Symbol: SMF6.5CA_C19077501; Device: SMF6.5CA_C19077501; LCSC Part Name: SMF6.5CA; Supplier Part: C19077501; Manufacturer Part: SMF6.5CA; Supplier Footprint: SOD-123FL; JLCPCB Part Class: Extended Part; Datasheet: https://atta.szlcsc.com/upload/public/pdf/source/20241029/BBF9A11676F655A5C9D4546A153AB943.pdf; Supplier: LCSC; Convert to PCB: yes; Operating Temperature: -55℃~+155℃
D4 D5 D7 = XL-1608SURC-06: Manufacturer: XINGLIGHT(成兴光); Add into BOM: yes; Illumination Color: 红色; Voltage - Forward(Vf): 2.3V; Power(Watts): 50mW; Forward Current: 20mA; Wavelength - Dominant: 620nm~630nm; Peak Wavelength: 625nm; Lens Color: 无色透明透镜; Luminous Intensity: 225mcd; Viewing Angle: 120°; Mounting Sytle: 正贴; Symbol: XL-1608SURC-06; Device: XL-1608SURC-06; LCSC Part Name: XL-1608SURC-06; Supplier Part: C965799; Manufacturer Part: XL-1608SURC-06; Supplier Footprint: 0603; JLCPCB Part Class: Extended Part; Datasheet: https://atta.szlcsc.com/upload/public/pdf/source/20250213/F9766CE804AF391355DCDD48DB3E0DAB.pdf; Supplier: LCSC; Convert to PCB: yes; Lamp Holder Type: -; Diode Configuration: -; Color Temperature: -; Operating Temperature: -20℃~+85℃
L1 L4-L7 = GZ1608D601TF: Manufacturer: Sunlord(顺络); Add into BOM: yes; Impedance @ Frequency: 600Ω@100MHz; Tolerance: ±25%; DC Resistance: 450mΩ; Current Rating: 200mA; Circuits: 1; Symbol: GZ1608D601TF; Device: GZ1608D601TF; LCSC Part Name: 单路 0603磁珠 阻抗600Ω@100MHz; Supplier Part: C1002; Manufacturer Part: GZ1608D601TF; Supplier Footprint: 0603; JLCPCB Part Class: Basic Part; Datasheet: https://atta.szlcsc.com/upload/public/pdf/source/20241120/893429B990C3BA07384E734821D2F218.pdf; Supplier: LCSC; Convert to PCB: yes
R1 R9 = RES: 电阻
R2-R4 R7 R14-R17 R23 R24 R26 R28 R30-R49 R53-R55 R58 R59 R61 R72 R73 = RSMT0625: Resistor; Manufacturer 1: Vishay; Manufacturer Part Number 1: CRCW060310K0FKEA; Tolerance: 1%; Description_: RES TKF 10k 1% 1/10W SMD 0603; Voltage: 75V; Temperature Coeffcient: 100ppm/C; Power: 1/10W; Populated: Yes; MCHP-ID: RSMT0625; Package: 0603; Revision: 1; Status: Production; ComponentLink1URL: https://chn-vm-apps.microchip.com/mchprepo/parts/Datasheets/dcrcwe3.pdf; ComponentLink1Description: Datasheet; Operating Temperature: -55C to +155C; Category: Resistor; Type: RES SMD; Composition: TKF; Manufacturer 2: ROHM; Manufacturer Part Number 2: MCR03EZPFX1002; Supplier 1: Digi-Key; Supplier Part Number 1: 541-10.0KHCT-ND; Supplier 2: Digi-Key; Supplier Part Number 2: RHM10.0KHCT-ND; Quantity Override: 1
R19 R20 R25 R56 R57 R60 R70 R71 R74-R80 R90-R92 = RSMT0001: Resistor; Manufacturer 1: Panasonic; Manufacturer Part Number 1: ERJ-3GSY0R00V; Description_: RES TKF 0R 1/10W SMD 0603; Power: 1/10W; Populated: Yes; MCHP-ID: RSMT0001; Package: 0603; Revision: 2; Status: Production; ComponentLink1URL: https://chn-vm-apps.microchip.com/mchprepo/parts/Datasheets/nrc.pdf; ComponentLink1Description: Datasheet; Operating Temperature: -55C to +155C; Category: Resistor; Type: RES SMD; Composition: TKF; Manufacturer 2: NIC Components; Manufacturer Part Number 2: NRC06Z0TRF; Manufacturer 3: Panasonic; Manufacturer Part Number 3: ERJ-3GEY0R00V; Manufacturer 4: Stackpole Electronics Inc; Manufacturer Part Number 4: RMCF0603ZT0R00; Manufacturer 5: Vishay; Manufacturer Part Number 5: CRCW06030000Z0EA; Manufacturer 6: Stackpole Electronics Inc; Manufacturer Part Number 6: RMCF 1/16 0 R; Manufacturer 7: Yageo; Manufacturer Part Number 7: RC0603JR-070RL; Manufacturer 8: KOA Speer; Manufacturer Part Number 8: RK73Z1JTTP; Manufacturer 9: ROHM; Manufacturer Part Number 9: MCR03EZPJ000; Supplier 2: NIC Components; Supplier Part Number 1: NRC06Z0TRF; Supplier 1: Digi-Key; Supplier Part Number 2: P0.0GTR-ND; Supplier 3: Digi-Key; Supplier Part Number 3: RMCF0603ZT0R00TR-ND; Supplier 4: Digi-Key; Supplier Part Number 4: RMCF0603ZT0R00CT-ND; Supplier 5: Digi-Key; Supplier Part Number 5: 541-0.0GCT-ND; Supplier 6: Digi-Key; Supplier Part Number 6: RMCF1/160RTR-ND; Supplier 7: Digi-Key; Supplier Part Number 7: 311-0.0GRCT-ND; Supplier 8: KOA Speer; Supplier Part Number 8: RK73Z1JTTP; Supplier 9: Digi-Key; Supplier Part Number 9: RHM0.0GCT-ND; Quantity Override: 1
R21 R22 R29 R50-R52 = RES1130: Resistor; Manufacturer 1: Panasonic; Manufacturer Part Number 1: ERJ-3EKF2201V; Tolerance: 1%; Description_: RES TKF 2.2k 1% 1/10W SMD 0603; Voltage: 75V; Temperature Coeffcient: 100ppm/C; Power: 1/10W; Owner: Bogdan P (M91398); Populated: Yes; MCHP-ID: RES1130; Package: 0603; Revision: 0; Status: Production; ComponentLink1URL: https://chn-vm-apps.microchip.com/mchprepo/parts/Datasheets/AOA0000CE2.pdf; ComponentLink1Description: Datasheet; Operating Temperature: -55C to +155C; Category: Resistor; Type: RES SMD; Composition: TKF; Supplier 1: Digi-Key; Supplier Part Number 1: P2.20KHCT-ND; Quantity Override: 1
SW1-SW4 = TS-1088R-02026: Manufacturer: XUNPU(讯普); Add into BOM: yes; Circuit: 单刀单掷; Actuator Style: 圆形按钮; Switch Length: 3.9mm; Switch Width: 2.93mm; Switch Height: 2mm; Contact Current: 50mA; Voltage Rating (DC): 12V; Symbol: TS-1088R-02026; Device: TS-1088R-02026; LCSC Part Name: 3.9*2.93*2mm 立贴 轻触开关; Supplier Part: C455280; Manufacturer Part: TS-1088R-02026; Supplier Footprint: SMD,3x4mm; JLCPCB Part Class: Extended Part; Datasheet: https://atta.szlcsc.com/upload/public/pdf/source/20191118/C455281_EC5379764BC1462550DF64BBBFEA9579.pdf; Supplier: LCSC; Convert to PCB: yes; Mounting Style: 立贴; With Lamp: -; Mechanical Life: -
TP1 TP2 TP4-TP12 = MISC0028: Manufacturer 1: Keystone; Manufacturer Part Number 1: 5002; Description_: MISC, TEST POINT MULTI PURPOSE MINI WHITE; Dev Tools Status: Production; MCHP-ID: MISC0028; Revision: 0; Symbol: Test Point; Status: MCL Design; ComponentLink1URL: https://chn-vm-apps.microchip.com/mchprepo/parts/Datasheets/5000-5004.PDF; ComponentLink1Description: SVN Datasheet; ComponentLink2URL: C:\ALTIUM_WORK\00001_MCHP-CDB\Datasheets\5000-5004.PDF; ComponentLink2Description: Local Datasheet; ComponentLink3URL: C:\ALTIUM_WORK\00001_MCHP-CDB\Library\LibraryRefs\Test Point.SchLib; ComponentLink3Description: Open Symbol; ComponentLink4URL: C:\ALTIUM_WORK\00001_MCHP-CDB\Library\Footprints\CON_TP_TH_V_WHT_KEC_5002.PcbLib; ComponentLink4Description: Open Footprint; ComponentLink5Description: Open Footprint 2; ComponentLink6Description: Open Footprint 3; ComponentLink7Description: Open Footprint 4; Type: Test Point; Category: Connector; Manufacturer 2: FuZhou XiXiang; Manufacturer Part Number 2: CONN00189B01; Supplier 1: Digi-Key; Supplier Part Number 1: 36-5002-ND; Supplier 2: Raynen; Supplier Part Number 2: CONN00189B01; Quantity Override: 1
TP3 TP14 = MISC0027: Manufacturer 1: Keystone; Manufacturer Part Number 1: 5000; Description_: MISC, TEST POINT MULTI PURPOSE MINI RED; Dev Tools Status: Production; Owner: Stephen Humberd; Populated: YES; MCHP-ID: MISC0027; Revision: 0; Symbol: Test Point; Status: MCL Design; ComponentLink1URL: https://chn-vm-apps.microchip.com/mchprepo/parts/Datasheets/5000-5004.PDF; ComponentLink1Description: SVN Datasheet; ComponentLink2URL: C:\ALTIUM_WORK\00001_MCHP-CDB\Datasheets\5000-5004.PDF; ComponentLink2Description: Local Datasheet; ComponentLink3URL: C:\ALTIUM_WORK\00001_MCHP-CDB\Library\LibraryRefs\Test Point.SchLib; ComponentLink3Description: Open Symbol; ComponentLink4URL: C:\ALTIUM_WORK\00001_MCHP-CDB\Library\Footprints\CON_TP_TH_V_RED_KEC_5000.PcbLib; ComponentLink4Description: Open Footprint; ComponentLink5Description: Open Footprint 2; ComponentLink6Description: Open Footprint 3; ComponentLink7Description: Open Footprint 4; Type: Test Point; Category: Connector; Supplier 1: Digi-Key; Supplier Part Number 1: 36-5000-ND; Quantity Override: 1
TP13 = MISC0028: Manufacturer 1: Keystone; Manufacturer Part Number 1: 5002; Description_: MISC, TEST POINT MULTI PURPOSE MINI WHITE; Dev Tools Status: Production; Populated: Yes; MCHP-ID: MISC0028; Revision: 0; Symbol: Test Point; Status: MCL Design; ComponentLink1URL: https://chn-vm-apps.microchip.com/mchprepo/parts/Datasheets/5000-5004.PDF; ComponentLink1Description: SVN Datasheet; ComponentLink2URL: C:\ALTIUM_WORK\00001_MCHP-CDB\Datasheets\5000-5004.PDF; ComponentLink2Description: Local Datasheet; ComponentLink3URL: C:\ALTIUM_WORK\00001_MCHP-CDB\Library\LibraryRefs\Test Point.SchLib; ComponentLink3Description: Open Symbol; ComponentLink4URL: C:\ALTIUM_WORK\00001_MCHP-CDB\Library\Footprints\CON_TP_TH_V_WHT_KEC_5002.PcbLib; ComponentLink4Description: Open Footprint; ComponentLink5Description: Open Footprint 2; ComponentLink6Description: Open Footprint 3; ComponentLink7Description: Open Footprint 4; Type: Test Point; Category: Connector; Manufacturer 2: FuZhou XiXiang; Manufacturer Part Number 2: CONN00189B01; Supplier 1: Digi-Key; Supplier Part Number 1: 36-5002-ND; Supplier 2: Raynen; Supplier Part Number 2: CONN00189B01; Quantity Override: 1
U1 = STM32F446RET6: Manufacturer: ST(意法半导体); Add into BOM: yes; CPU Core: ARM-M4; CPU Maximum Speed: 180MHz; CPU Bit Width: 32bit; Program Storage Size: 512KB; Program Memory Type: FLASH; Number of I/O: 50; ADC (Bit): 12bit; Voltage - Supply: 1.7V~3.6V; Symbol: STM32F446RET6; Device: STM32F446RET6; LCSC Part Name: MSL=3 带DSP和FPU的高性能基础系列ARM Cortex-M4 MCU，具有512 KB Flash、180 MHz CPU、ART加速器和双QSPI; Supplier Part: C69336; Manufacturer Part: STM32F446RET6; Supplier Footprint: LQFP-64(10x10); JLCPCB Part Class: Extended Part; Datasheet: https://atta.szlcsc.com/upload/public/pdf/source/20170518/1495086068896.pdf; Supplier: LCSC; Convert to PCB: yes; DAC (Bit): 12bit; Applications: -
U2 U4 = ATA6561-GAQW: Manufacturer: MICROCHIP(美国微芯); Add into BOM: yes; Data Rate: 5Mbps; Voltage - Supply: 4.5V~5.5V; Current - Supply: 70mA; Symbol: ATA6561-GAQW; Device: ATA6561-GAQW; LCSC Part Name: 高速CAN收发器，具有待机模式; Supplier Part: C2929602; Manufacturer Part: ATA6561-GAQW; Supplier Footprint: SOIC-8; JLCPCB Part Class: Extended Part; Datasheet: https://atta.szlcsc.com/upload/public/pdf/source/20211008/C2671262_D7FCCB811013C7D69A57B5A2D230BAD0.pdf; Supplier: LCSC; Convert to PCB: yes; Type: CAN收发器; Operating Temperature: -40℃~+150℃
U3 = MCP1825-ADJE/ET: Manufacturer: MICROCHIP(美国微芯); Add into BOM: yes; Symbol: MCP1825-ADJE/ET; Device: MCP1825-ADJE/ET; LCSC Part Name: MCP1825-ADJE/ET; Supplier Part: C641133; Manufacturer Part: MCP1825-ADJE/ET; Supplier Footprint: TO-252-5; JLCPCB Part Class: Extended Part; Datasheet: https://atta.szlcsc.com/upload/public/pdf/source/20221017/D7EA2E86F60CF265ECA55E2EC16558B7.pdf; Supplier: LCSC; Convert to PCB: yes
U5-U10 U12-U15 U17 U18 U21 = WAFER-GH1.25-4PWB: Manufacturer: XUNPU(讯普); Add into BOM: yes; Pins Structure: 1x4P; Pitch: 1.25mm; Reference Series: GH; Number of PINs Per Row: 4; Current Rating: 1A; Voltage Rating: 125V; Plastic Material: LCP; Supplementary Features: 辅助焊脚; Z-Height of the Board: 4.35mm; X-Length of Bottom Edge on Board (Spacing Line): 8.25mm; Y-Width of Bottom Edge on Board: 5mm; Symbol: WAFER-GH1.25-4PWB; Device: WAFER-GH1.25-4PWB; LCSC Part Name: 1x4P 间距:1.25mm 卧贴 系列:GH; Supplier Part: C3029379; Manufacturer Part: WAFER-GH1.25-4PWB; Supplier Footprint: SMD,P=1.25mm,卧贴; JLCPCB Part Class: Extended Part; Datasheet: https://atta.szlcsc.com/upload/public/pdf/source/20220527/CB8773BFB0913C3B8ABD62CB38BA101A.pdf; Supplier: LCSC; Convert to PCB: yes; Mounting Type: 卧贴; Number of Pins: 4P; Number of Rows: 1; Row Spacing: -; Contact Material: 黄铜; Contact Plating: -; Operating Temperature: -25℃~+85℃; Flame Retardant Rating: -; Color: 米色
U11 U16 = ESD2CAN24DBZRQ1: Manufacturer: TI(德州仪器); Add into BOM: yes; Reverse Stand-Off Voltage (Vrwm): 24V; Maximum Clamping Voltage: 37V; Breakdown Voltage: 35.5V; Symbol: ESD2CAN24DBZRQ1; Device: ESD2CAN24DBZRQ1; LCSC Part Name: ESD2CAN24DBZRQ1; Supplier Part: C5736151; Manufacturer Part: ESD2CAN24DBZRQ1; Supplier Footprint: SOT-23-3; JLCPCB Part Class: Extended Part; Datasheet: https://atta.szlcsc.com/upload/public/pdf/source/20230921/17CC51E991FF2C2961D299C09F950559.pdf; Supplier: LCSC; Convert to PCB: yes; Type: TVS
U19 = MIC7449: Manufacturer 1: Microchip Technology; Manufacturer Part Number 1: LAN9252I/ML; Description_: EtherCAT Slave Controller with dual integrated PHYs; Dev Tools Status: Production; Owner: Dragos Danaila; Populated: YES; MCHP-ID: MIC7449; Symbol: LAN9252 QFN-64; Type: Ethernet; Status: MCL Design; Revision: 1; Category: MCHP-Interface; ComponentLink1Description: SVN Datasheet; ComponentLink2URL: C:\ALTIUM_WORK\00001_MCHP-CDB\Datasheets\00001909A.pdf; ComponentLink2Description: Local Datasheet; ComponentLink3URL: C:\ALTIUM_WORK\00001_MCHP-CDB\Library\LibraryRefs\LAN9252 QFN-64.SchLib; ComponentLink3Description: Open Symbol; ComponentLink4URL: C:\ALTIUM_WORK\00001_MCHP-CDB\Library\Footprints\QFN-64_9X9_EP6.PcbLib; ComponentLink4Description: Open Footprint; ComponentLink5Description: Open Footprint 2; ComponentLink6Description: Open Footprint 3; ComponentLink7Description: Open Footprint 4; Supplier 1: Digi-Key; Supplier Part Number 1: LAN9252I/ML-ND; Quantity Override: 1
U20 = G2426S: Manufacturer: CND-tek(磁联达); Add into BOM: yes; Turns Ratio: 1:1; port: 单口; rate: 1000M; Inductor: 350uH; HI-POT: 1.5kV; Symbol: G2426S; Device: G2426S; LCSC Part Name: G2426S; Supplier Part: C5122140; Manufacturer Part: G2426S; Supplier Footprint: SMD-24P,16.5x9mm; JLCPCB Part Class: Extended Part; Datasheet: https://atta.szlcsc.com/upload/public/pdf/source/20241014/0B80D5D469EC1AC696135756317C671C.pdf; Supplier: LCSC; Convert to PCB: yes; function: -; operating temperature: 0℃~+70℃
U22 = AT24C128C-SSHM-T: Manufacturer: MICROCHIP(美国微芯); Add into BOM: yes; Interface Type: I2C; Memory Size: 128Kbit; Supply Voltage: 1.7V~5.5V; Symbol: AT24C128C-SSHM-T; Device: AT24C128C-SSHM-T; LCSC Part Name: AT24C128C-SSHM-T; Supplier Part: C6478; Manufacturer Part: AT24C128C-SSHM-T; Supplier Footprint: SOIC-8; JLCPCB Part Class: Extended Part; Datasheet: https://atta.szlcsc.com/upload/public/pdf/source/20210322/C616767_73C40D6AF3E7F03B3009A73CDE6E5E94.pdf; Supplier: LCSC; Convert to PCB: yes; Operating Temperature: -40℃~+85℃
X1 = X32258MSB4SI: Manufacturer: YXC(扬兴晶振); Add into BOM: yes; Value: 8MHz; Normal temperature Frequency Tolerance: ±10ppm; Load Capacitance: 20pF; Frequency Stability: ±20ppm; Equivalent Series Resistance(ESR): 120Ω; Symbol: X32258MSB4SI; Device: X32258MSB4SI; LCSC Part Name: YSX321SL 8MHZ 4P 3225 20PF ±10PPM -40~85℃ (±20PPM); Supplier Part: C2682774; Manufacturer Part: X32258MSB4SI; Supplier Footprint: SMD3225-4P; JLCPCB Part Class: Extended Part; Datasheet: https://atta.szlcsc.com/upload/public/pdf/source/20240329/19D5F850207469550BEB00D7DFEDBC7A.pdf; Supplier: LCSC; Convert to PCB: yes; Type: 贴片晶振; Operating Temperature: -40℃~+85℃
X2 = XL2EL89CSI-111YLC-25M: Manufacturer: YXC(扬兴晶振); Add into BOM: yes; Value: 25MHz; Normal temperature Frequency Tolerance: ±10ppm; Load Capacitance: 20pF; Frequency Stability: ±20ppm; Symbol: XL2EL89CSI-111YLC-25M; Device: XL2EL89CSI-111YLC-25M; LCSC Part Name: YSX321SL 25MHZ 4P 3225 20PF ±10PPM -40~85℃ (±20PPM); Supplier Part: C5280577; Manufacturer Part: XL2EL89CSI-111YLC-25M; Supplier Footprint: SMD3225-4P; JLCPCB Part Class: Extended Part; Datasheet: https://atta.szlcsc.com/upload/public/pdf/source/20240329/19D5F850207469550BEB00D7DFEDBC7A.pdf; Supplier: LCSC; Convert to PCB: yes; Type: 贴片晶振; Operating Temperature: -40℃~+85℃
Y1 = XKXGI-SUA-32.768K: Manufacturer: YXC(扬兴晶振); Add into BOM: yes; Value: 32.768kHz; Normal temperature Frequency Tolerance: ±20ppm; Load Capacitance: 12.5pF; Frequency Stability: ±30ppm; Symbol: XKXGI-SUA-32.768K; Device: XKXGI-SUA-32.768K; LCSC Part Name: YST310S 32.768KHZ 2P 3215 12.5PF ±20PPM -40~85℃; Supplier Part: C5213671; Manufacturer Part: XKXGI-SUA-32.768K; Supplier Footprint: SMD3215-2P; JLCPCB Part Class: Extended Part; Datasheet: https://atta.szlcsc.com/upload/public/pdf/source/20240329/3A7650FD985DD0DE85694D3785AB4916.pdf; Supplier: LCSC; Convert to PCB: yes; Type: 贴片晶振; Operating Temperature: -40℃~+85℃